# Altium schematic sheet 12V-036A3（7X7）-WaterPump-200W-V1.0.SchDoc
size A3
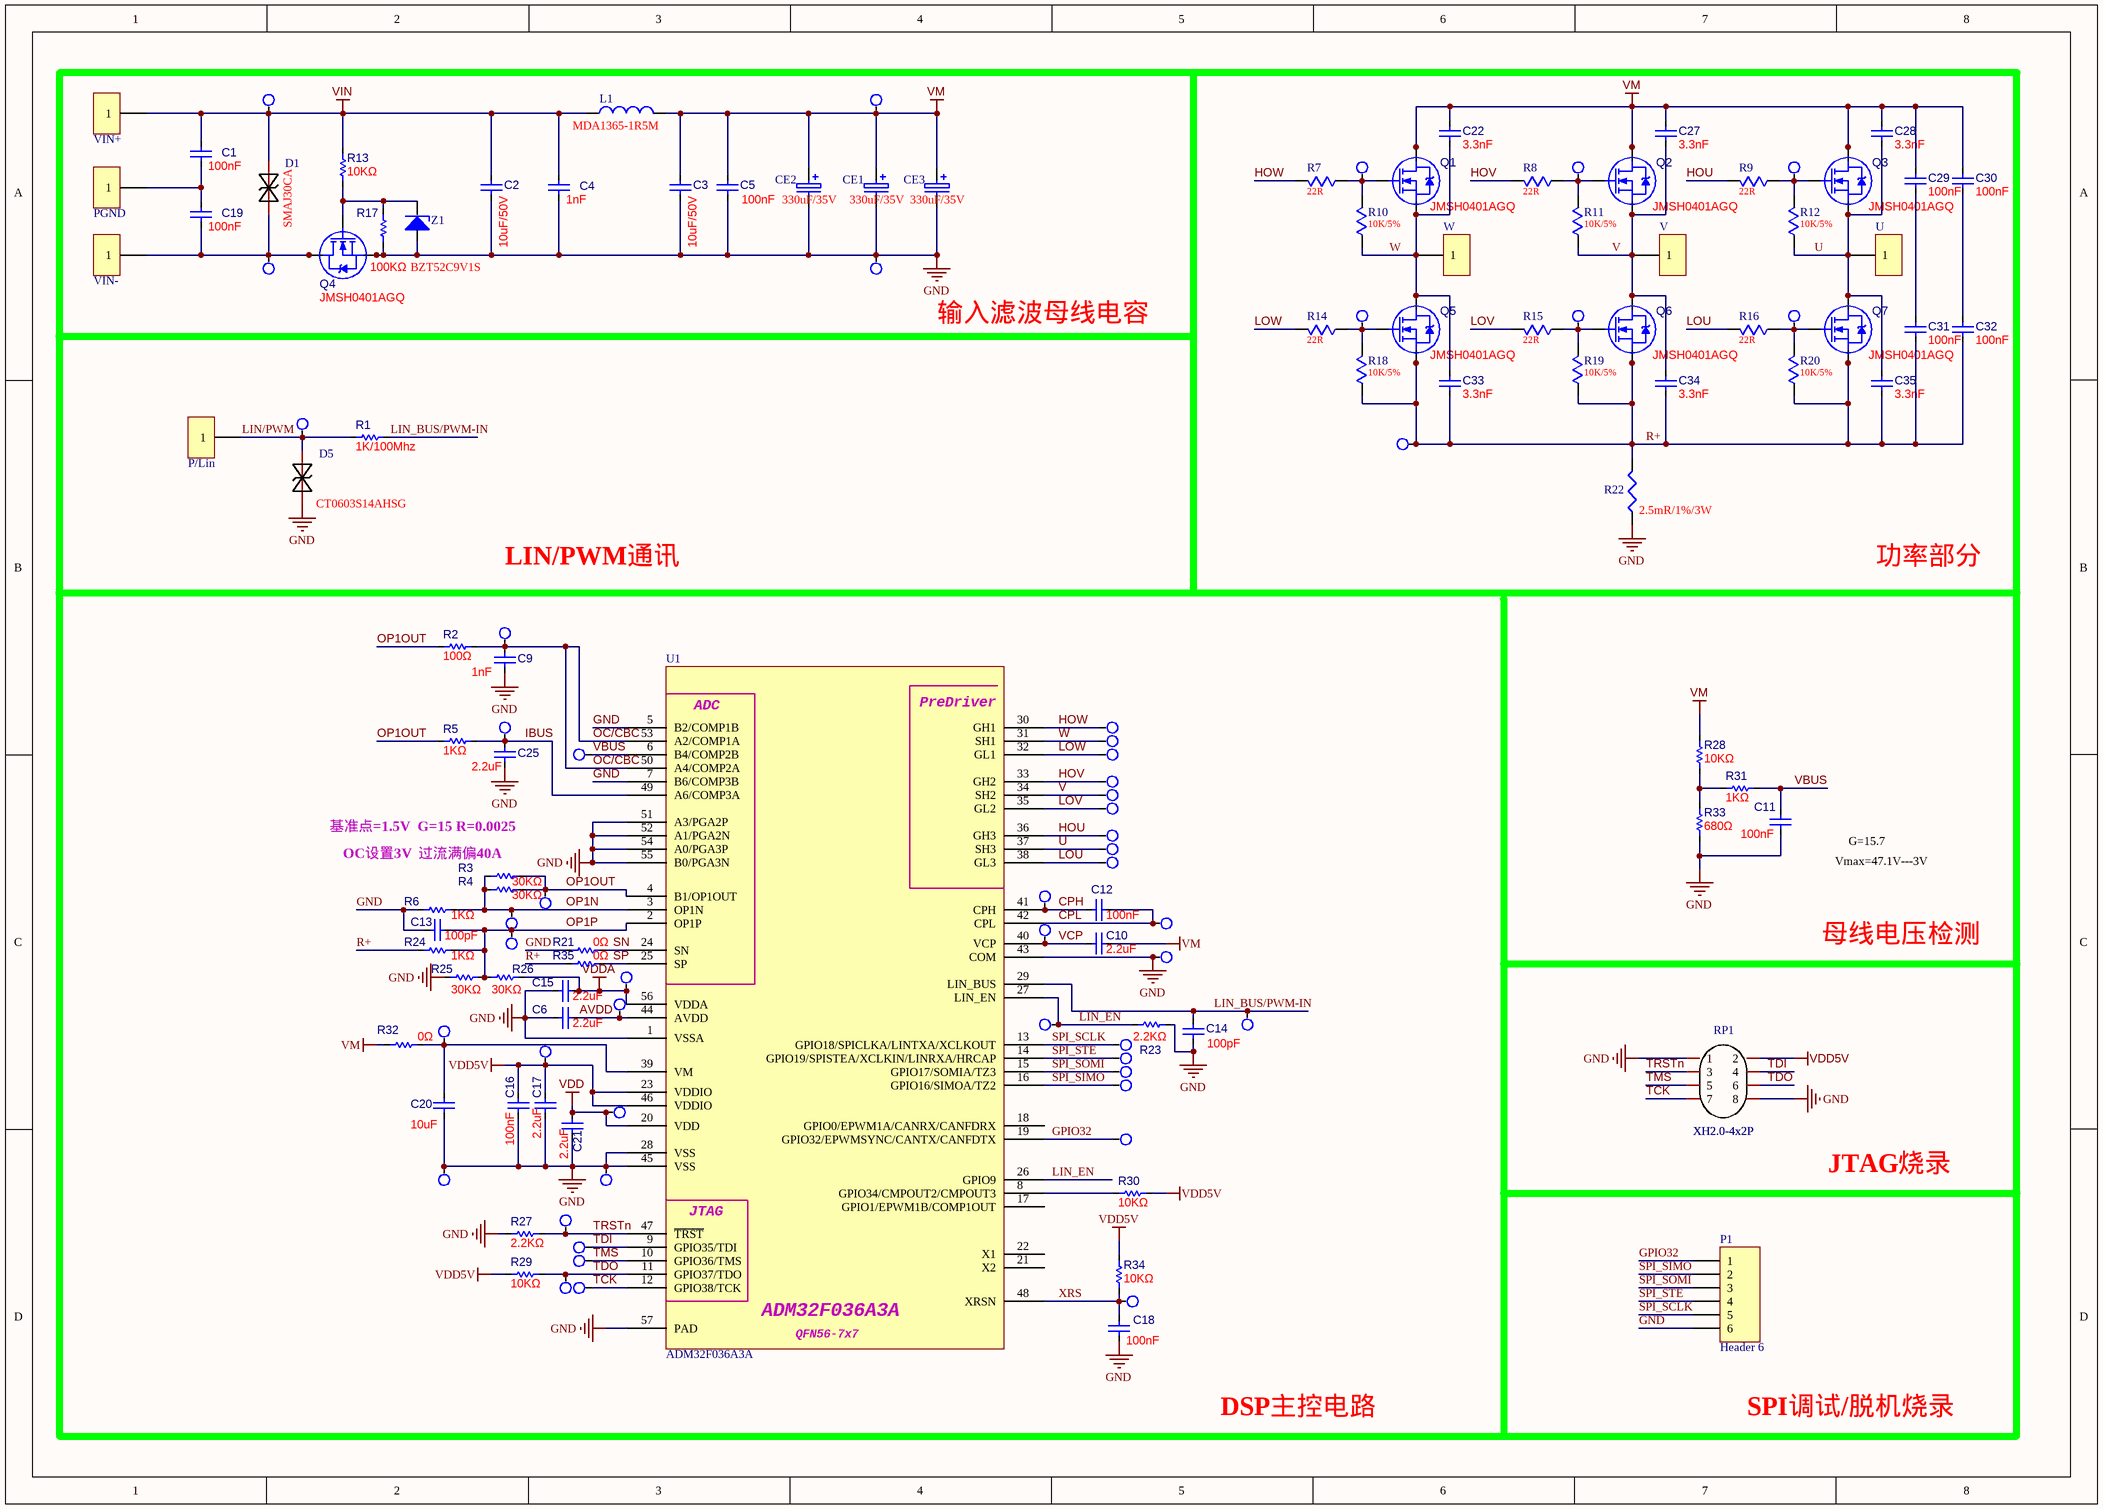
[diagram p0: 12V-036A3（7X7）-WaterPump-200W-V1.0.SchDoc]

## Parts
C1  100nF  [0603C-X]
C2  10uF/50V  [1210C-X]
C3  10uF/50V  [1210C-X]
C4  1nF  [0603C-X]
C5  100nF  [0603C-X]
C6  2.2uF  [0603C-X]
C9  1nF  [0603C-X]
C10  2.2uF  [0805C-X]
C11  100nF  [0603C-X]
C12  100nF  [0603C-X]
C13  100pF  [0603C-X]
C14  100pF  [0603C-X]
C15  2.2uF  [0603C-X]
C16  100nF  [0603C-X]
C17  2.2uF  [0603C-X]
C18  100nF  [0603C-X]
C19  100nF  [0603C-X]
C20  10uF  [0805C-X]
C21  2.2uF  [0603C-X]
C22  3.3nF  [0603C-X]
C25  2.2uF  [0603C-X]
C27  3.3nF  [0603C-X]
C28  3.3nF  [0603C-X]
C29  100nF  [0603C-X]
C30  100nF  [0603C-X]
C31  100nF  [0603C-X]
C32  100nF  [0603C-X]
C33  3.3nF  [0603C-X]
C34  3.3nF  [0603C-X]
C35  3.3nF  [0603C-X]
CE1  330uF/35V  [CAP_SMD10*10.5]
CE2  330uF/35V  [CAP_SMD10*10.5]
CE3  330uF/35V  [CAP_SMD10*10.5]
D1  SMAJ30CA  [SMA]
D5  CT0603S14AHSG  [0603R-X]
L1  MDA1365-1R5M  [L 13.5*12.6*6.2]
P1  Header 6  [HDR1X6]
P/Lin  HOLD  [HP-1.4*3.5mm]  (value not drawn)
PGND  HOLD  [M3*8]  (value not drawn)
Q1  JMSH0401AGQ  [QFN5*6 （N）]
Q2  JMSH0401AGQ  [QFN5*6 （N）]
Q3  JMSH0401AGQ  [QFN5*6 （N）]
Q4  JMSH0401AGQ  [QFN5*6 （N）]
Q5  JMSH0401AGQ  [QFN5*6 （N）]
Q6  JMSH0401AGQ  [QFN5*6 （N）]
Q7  JMSH0401AGQ  [QFN5*6 （N）]
R1  1K/100Mhz  [0603R-X]
R2  100Ω  [0603R-X]
R3  30KΩ  [0603R-X]
R4  30KΩ  [0603R-X]
R5  1KΩ  [0603R-X]
R6  1KΩ  [0603R-X]
R7  22R  [0603R-X]
R8  22R  [0603R-X]
R9  22R  [0603R-X]
R10  10K/5%  [0603R-X]
R11  10K/5%  [0603R-X]
R12  10K/5%  [0603R-X]
R13  10KΩ  [0603R-X]
R14  22R  [0603R-X]
R15  22R  [0603R-X]
R16  22R  [0603R-X]
R17  100KΩ  [0603R-X]
R18  10K/5%  [0603R-X]
R19  10K/5%  [0603R-X]
R20  10K/5%  [0603R-X]
R21  0Ω  [0603R-X]
R22  2.5mR/1%/3W  [2512R-X]
R23  2.2KΩ  [0603R-X]
R24  1KΩ  [0603R-X]
R25  30KΩ  [0603R-X]
R26  30KΩ  [0603R-X]
R27  2.2KΩ  [0603R-X]
R28  10KΩ  [0603R-X]
R29  10KΩ  [0603R-X]
R30  10KΩ  [0603R-X]
R31  1KΩ  [0603R-X]
R32  0Ω  [0805R-X]
R33  680Ω  [0603R-X]
R34  10KΩ  [0603R-X]
R35  0Ω  [0603R-X]
RP1  XH2.0-4x2P  [DIP2.0-2*4]
TP1  TEST-Point  [TP_SMT-1]  (value not drawn)
TP2  TEST-Point  [TP_SMT-1]  (value not drawn)
TP3  TEST-Point  [TP_SMT-1]  (value not drawn)
TP4  TEST-Point  [TP_SMT-1]  (value not drawn)
TP5  TEST-Point  [TP_SMT-1]  (value not drawn)
TP6  TEST-Point  [TP_SMT-1]  (value not drawn)
TP7  TEST-Point  [TP_SMT-1]  (value not drawn)
TP8  TEST-Point  [TP_SMT-1]  (value not drawn)
TP9  TEST-Point  [TP_SMT-1]  (value not drawn)
TP10  TEST-Point  [TP_SMT-1]  (value not drawn)
TP11  TEST-Point  [TP_SMT-1]  (value not drawn)
TP12  TEST-Point  [TP_SMT-1]  (value not drawn)
TP13  TEST-Point  [TP_SMT-1]  (value not drawn)
TP14  TEST-Point  [TP_SMT-1]  (value not drawn)
TP15  TEST-Point  [TP_SMT-1]  (value not drawn)
TP16  TEST-Point  [TP_SMT-1]  (value not drawn)
TP17  TEST-Point  [TP_SMT-1]  (value not drawn)
TP18  TEST-Point  [TP_SMT-1]  (value not drawn)
TP19  TEST-Point  [TP_SMT-1]  (value not drawn)
TP20  TEST-Point  [TP_SMT-1]  (value not drawn)
TP21  TEST-Point  [TP_SMT-1]  (value not drawn)
TP22  TEST-Point  [TP_SMT-1]  (value not drawn)
TP23  TEST-Point  [TP_SMT-1]  (value not drawn)
TP24  TEST-Point  [TP_SMT-1]  (value not drawn)
TP25  TEST-Point  [TP_SMT-1]  (value not drawn)
TP26  TEST-Point  [TP_SMT-1]  (value not drawn)
TP27  TEST-Point  [TP_SMT-1]  (value not drawn)
TP28  TEST-Point  [TP_SMT-1]  (value not drawn)
TP29  TEST-Point  [TP_SMT-1]  (value not drawn)
TP30  TEST-Point  [TP_SMT-1]  (value not drawn)
TP31  TEST-Point  [TP_SMT-1]  (value not drawn)
TP32  TEST-Point  [TP_SMT-1]  (value not drawn)
TP33  TEST-Point  [TP_SMT-1]  (value not drawn)
TP34  TEST-Point  [TP_SMT-1]  (value not drawn)
TP35  TEST-Point  [TP_SMT-1]  (value not drawn)
TP36  TEST-Point  [TP_SMT-1]  (value not drawn)
TP37  TEST-Point  [TP_SMT-1]  (value not drawn)
TP38  TEST-Point  [TP_SMT-1]  (value not drawn)
TP39  TEST-Point  [TP_SMT-1]  (value not drawn)
TP40  TEST-Point  [TP_SMT-1]  (value not drawn)
TP41  TEST-Point  [TP_SMT-1]  (value not drawn)
TP42  TEST-Point  [TP_SMT-1]  (value not drawn)
TP43  TEST-Point  [TP_SMT-1]  (value not drawn)
TP44  TEST-Point  [TP_SMT-1]  (value not drawn)
TP45  TEST-Point  [TP_SMT-1]  (value not drawn)
TP46  TEST-Point  [TP_SMT-1]  (value not drawn)
TP47  TEST-Point  [TP_SMT-1]  (value not drawn)
TP48  TEST-Point  [TP_SMT-1]  (value not drawn)
TP49  TEST-Point  [TP_SMT-1]  (value not drawn)
TP50  TEST-Point  [TP_SMT-1]  (value not drawn)
TP51  TEST-Point  [TP_SMT-1]  (value not drawn)
U  HOLD  [HP-3*5]  (value not drawn)
U1  ADM32F036A3A  [QFN56-7X7-04P]
V  HOLD  [HP-3*5]  (value not drawn)
VIN+  HOLD  [HP-1.4*3.5mm]  (value not drawn)
VIN-  HOLD  [HP-1.4*3.5mm]  (value not drawn)
W  HOLD  [HP-3*5]  (value not drawn)
Z1  BZT52C9V1S  [DIO-SOD323-X]

## Nets
GND: C2.2 C3.2 C4.1 C5.2 C6.2 C9.1 C11.1 C13.2 C14.2 C15.1 C16.1 C17.1 C18.2 C20.1 C21.1 C25.1 CE1.2 CE2.2 CE3.2 D5.1 P1.6 Q4.1(S) Q4.2(S) Q4.3(S) R6.1 R17.1 R21.1 R22.1 R23.2 R25.1 R27.1 R33.2 RP1.1 RP1.8 TP7.1 TP28.1 TP49.1 TP51.1 U1.1(VSSA) U1.5(B2/COMP1B) U1.7(B6/COMP3B) U1.28(VSS) U1.43(COM) U1.45(VSS) U1.51(A3/PGA2P) U1.52(A1/PGA2N) U1.54(A0/PGA3P) U1.55(B0/PGA3N) U1.57(PAD) Z1.1
VDD: C21.2 TP48.1 U1.20(VDD)
VDD5V: C16.2 C17.2 R29.1 R30.1 R34.2 RP1.2 TP46.1 U1.23(VDDIO) U1.46(VDDIO)
VDDA: C15.2 R26.2 TP39.1 U1.56(VDDA)
VIN: C1.2 C2.1 C4.2 D1.2 L1.1 R13.2 TP1.1 VIN+.1
VM: C3.1 C5.1 C10.2 C22.1 C27.1 C28.1 C29.1 C30.1 CE1.1 CE2.1 CE3.1 L1.2 Q1.5(D) Q1.6(D) Q1.7(D) Q1.8(D) Q1.9(D) Q2.5(D) Q2.6(D) Q2.7(D) Q2.8(D) Q2.9(D) Q3.5(D) Q3.6(D) Q3.7(D) Q3.8(D) Q3.9(D) R28.1 R32.2 TP2.1
AVDD: C6.1 TP40.1 U1.44(AVDD)
CPH: C12.1 TP13.1 U1.41(CPH)
CPL: C12.2 TP18.1 U1.42(CPL)
GPIO32: P1.1 TP50.1 U1.19(GPIO32/EPWMSYNC/CANTX/CANFDTX)
HOU: R9.2 TP22.1 U1.36(GH3)
HOV: R8.2 TP19.1 U1.33(GH2)
HOW: R7.2 TP14.1 U1.30(GH1)
IBUS: C25.2 R5.2 TP41.1 U1.49(A6/COMP3A)
LIN/PWM: D5.2 P/Lin.1 R1.1 TP12.1
LIN_BUS/PWM-IN: C14.1 R1.2 TP30.1 U1.29(LIN_BUS)
LIN_EN: R23.1 TP32.1 U1.26(GPIO9) U1.27(LIN_EN)
LOU: R16.2 TP26.1 U1.38(GL3)
LOV: R15.2 TP25.1 U1.35(GL2)
LOW: R14.2 TP24.1 U1.32(GL1)
OC/CBC: C9.2 R2.2 TP15.1 U1.50(A4/COMP2A) U1.53(A2/COMP1A)
OP1N: R3.1 R4.1 R6.2 TP31.1 U1.3(OP1N)
OP1OUT: R2.1 R3.2 R4.2 R5.1 TP29.1 U1.4(B1/OP1OUT)
OP1P: C13.1 R24.2 R25.2 R26.1 TP33.1 U1.2(OP1P)
R+: C31.2 C32.2 C33.2 C34.2 C35.2 Q5.1(S) Q5.2(S) Q5.3(S) Q6.1(S) Q6.2(S) Q6.3(S) Q7.1(S) Q7.2(S) Q7.3(S) R18.1 R19.1 R20.1 R22.2 R24.1 R35.1 TP11.1
SN: R21.2 U1.24(SN)
SP: R35.2 U1.25(SP)
SPI_SCLK: P1.5 TP34.1 U1.13(GPIO18/SPICLKA/LINTXA/XCLKOUT)
SPI_SIMO: P1.2 TP37.1 U1.16(GPIO16/SIMOA/TZ2)
SPI_SOMI: P1.3 TP36.1 U1.15(GPIO17/SOMIA/TZ3)
SPI_STE: P1.4 TP35.1 U1.14(GPIO19/SPISTEA/XCLKIN/LINRXA/HRCAP)
TCK: RP1.7 TP43.1 U1.12(GPIO38/TCK)
TDI: RP1.4 TP21.1 U1.9(GPIO35/TDI)
TDO: R29.2 RP1.6 TP44.1 U1.11(GPIO37/TDO)
TMS: RP1.5 TP42.1 U1.10(GPIO36/TMS)
TRSTn: R27.2 RP1.3 TP38.1 U1.47(~{TRST})
U: C28.2 C35.1 Q3.1(S) Q3.2(S) Q3.3(S) Q7.5(D) Q7.6(D) Q7.7(D) Q7.8(D) Q7.9(D) R12.1 TP23.1 U.1 U1.37(SH3)
V: C27.2 C34.1 Q2.1(S) Q2.2(S) Q2.3(S) Q6.5(D) Q6.6(D) Q6.7(D) Q6.8(D) Q6.9(D) R11.1 TP20.1 U1.34(SH2) V.1
VBUS: C11.2 R31.2 TP17.1 U1.6(B4/COMP2B)
VCP: C10.1 TP27.1 U1.40(VCP)
W: C22.2 C33.1 Q1.1(S) Q1.2(S) Q1.3(S) Q5.5(D) Q5.6(D) Q5.7(D) Q5.8(D) Q5.9(D) R10.1 TP16.1 U1.31(SH1) W.1
XRS: C18.1 R34.1 TP47.1 U1.48(XRSN)
NetC1_1: C1.1 C19.2 PGND.1
NetC19_1: C19.1 D1.1 Q4.5(D) Q4.6(D) Q4.7(D) Q4.8(D) Q4.9(D) TP6.1 VIN-.1
NetC20_2: C20.2 R32.1 TP45.1 U1.39(VM)
NetC29_2: C29.2 C31.1
NetC30_2: C30.2 C32.1
NetQ1_4: Q1.4(G) R7.1 R10.2 TP3.1
NetQ2_4: Q2.4(G) R8.1 R11.2 TP4.1
NetQ3_4: Q3.4(G) R9.1 R12.2 TP5.1
NetQ4_4: Q4.4(G) R13.1 R17.2 Z1.2
NetQ5_4: Q5.4(G) R14.1 R18.2 TP8.1
NetQ6_4: Q6.4(G) R15.1 R19.2 TP9.1
NetQ7_4: Q7.4(G) R16.1 R20.2 TP10.1
NetR28_2: R28.2 R31.1 R33.1
NetR30_2: R30.2 U1.8(GPIO34/CMPOUT2/CMPOUT3)

Not connected (* = marked no-connect by the designer): U1 17(GPIO1/EPWM1B/COMP1OUT) 18(GPIO0/EPWM1A/CANRX/CANFDRX) 21(X2) 22(X1)

## Notes on the sheet
- 输入滤波母线电容
- LIN/PWM通讯
- 功率部分
- 基准点=1.5V  G=15 R=0.0025
- OC设置3V  过流满偏40A
- G=15.7
- Vmax=47.1V---3V
- 母线电压检测
- JTAG烧录
- DSP主控电路
- SPI调试/脱机烧录
- (in symbol ADM32F036A3A_1) ADC; PreDriver; JTAG; QFN56-7x7

## Library data of the parts
C1-C6 C9-C22 C25 C27-C35 = Cap: 贴片电容; Published: 8-Jun-2000; LatestRevisionDate: 17-Jul-2002; LatestRevisionNote: Re-released for DXP Platform.; Publisher: Altium Limited
CE1-CE3 = ELEC: 高温电解220UF/50V_8*16_RE环*
D1 D5 = SMCJ26CA: Manufacturer: PAKER(派克微); Symbol: SMCJ26CA_C3012577; Add into BOM: yes; NAME: 2; Pin Type: IN; Device: SMCJ26CA; LCSC Part Name: SMCJ26CA; Supplier Part: C3012577; Manufacturer Part: SMCJ26CA; Supplier Footprint: SMC; JLCPCB Part Class: Extended Part; Datasheet: https://atta.szlcsc.com/upload/public/pdf/source/20220607/6FBEE1574BED151AFE72B096AAF02965.pdf; Supplier: LCSC; Convert to PCB: yes; NUMBER: 2
L1 = Inductor: Code_IEC: 1005; Published: 8-Jun-2000; LatestRevisionDate: 29-May-2009; LatestRevisionNote: IPC-7351 Footprint Added.; PackageReference: 0402-A; Publisher: Altium Limited; PackageDescription: Chip Inductor; Code_JEITA: 0402
P1 = Header 6: Header, 6-Pin; LatestRevisionDate: 17-Jul-2002; LatestRevisionNote: Re-released for DXP Platform.; Publisher: Altium Limited
P/Lin PGND U V VIN+ VIN- W = CON2
Q1-Q7 = BSC190N15NS3G: 30V 150A
R1-R6 R13 R17 R21 R23-R35 = Res: 贴片电阻; Published: 8-Jun-2000; LatestRevisionDate: 17-Jul-2002; LatestRevisionNote: Re-released for DXP Platform.; Publisher: Altium Limited
R7-R12 R14-R16 R18-R20 = RZ
R22 = RES(S: SMT电阻RR2512_0R05_F_1W_200V_环保 ZH; SYS ID: 120101451
RP1 = XH2.0-4x2P: ------; Symbol: CON4X2; Add into BOM: yes; Name: XH2.0-4x2P; Device: XH2.0-4x2P; Convert to PCB: yes; Origin Footprint: DIP2.0-2*4; Design Item ID: CON4X2; Library Name: *
U1 = ADM32F036A3A_1: 进芯电机驱动专用芯片
Z1 = ZENER1: Zener Diode